# Altium project Baseboard-v3.1.PrjPcb (part 8 of 8)
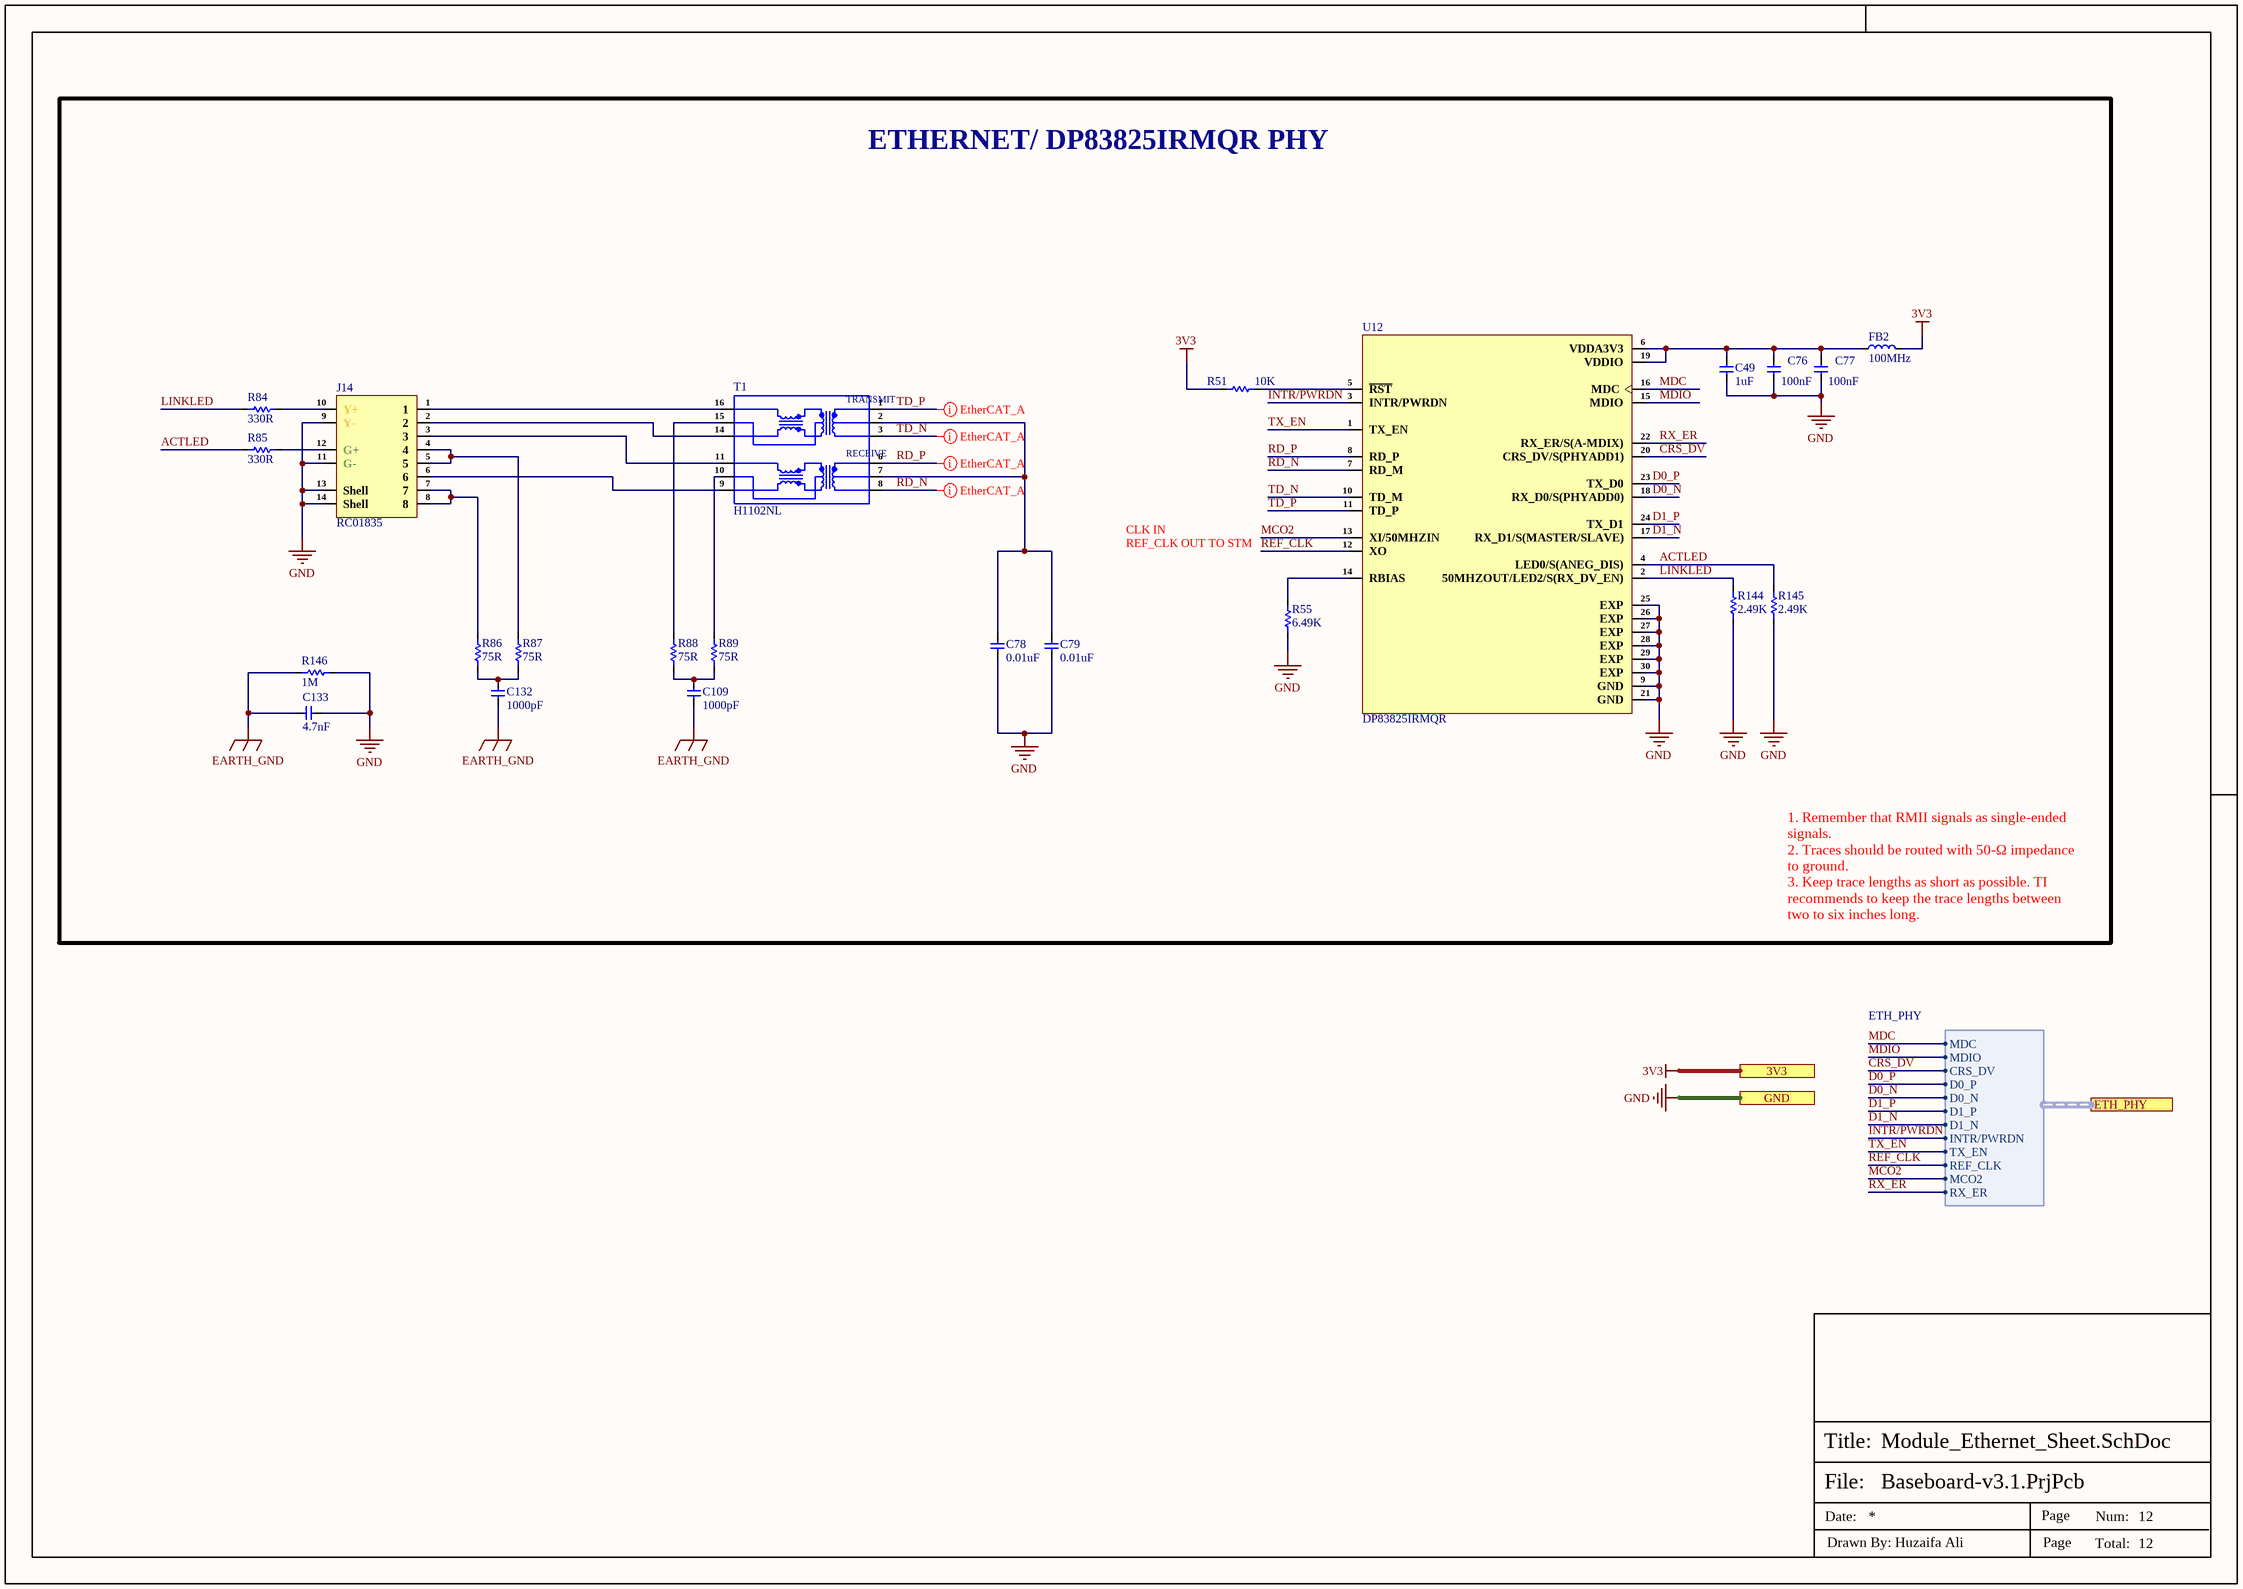
[diagram p12: Module_Ethernet_Sheet.SchDoc]

## Nets that join several sheets
3V3: GPIOs_Expander_Relay_Sheet (12 pins), OLED_Sheet (6 pins), Power_Sheet (6 pins), RS485_RS232_Sheet (9 pins), Controller_Sheet (22 pins), LTE_Sheet (C81.2 C83.2 U10.7 U11.7), ESP32-C3_Sheet (20 pins), DIAL_Sheet (11 pins), Module_Ethernet_Sheet (FB2.2 R51.1)
5V: GPIOs_Expander_Relay_Sheet (5 pins), OLED_Sheet (C123.2 R139.2 U20.1), Power_Sheet (14 pins)
+12V: Power_Sheet (C33.1 L2.2 P10.1 U1.4), DIAL_Sheet (C51.2 C52.2 C53.2 L3.2)
GND: Connector (11 pins), GPIOs_Expander_Relay_Sheet (14 pins), OLED_Sheet (29 pins), Power_Sheet (43 pins), RS485_RS232_Sheet (11 pins), Controller_Sheet (25 pins), LTE_Sheet (47 pins), LTE_1 (79 pins), ESP32-C3_Sheet (28 pins), DIAL_Sheet (24 pins), Module_Ethernet_Sheet (22 pins)
GSM_PWR: Power_Sheet (6 pins), LTE_Sheet (R91.2 R100.2), LTE_1 (D18.2 FB3.2)
GSM_PWR_2: Power_Sheet (6 pins), LTE_Sheet (R90.2 R99.2), LTE_1 (D25.2 FB4.2)
SIM1_VDD_1: LTE_Sheet (C84.2 J15.C1 U14.5), LTE_1 (U16.18)
SIM1_VDD_2: LTE_Sheet (SB1.1), LTE_1 (U17.18)
SIM2_VDD_1: LTE_Sheet (SB3.1), LTE_1 (U16.56)
USB_VBUS: LTE_Sheet (F3.1), LTE_1 (R142.1 R143.1)
VCC: Connector (D2.2 F2.2), Power_Sheet (9 pins)
VDD_EXT_1: LTE_Sheet (R58.2 SB5.1), LTE_1 (C100.2 U16.40)
VDD_EXT_2: LTE_Sheet (C80.2 SB7.1 U10.3 U10.6), LTE_1 (C101.2 U17.40)
13PIN_TERMINAL.INPUT_1: Connector (J4.1), GPIOs_Expander_Relay_Sheet (R35.2)
13PIN_TERMINAL.INPUT_2: Connector (J4.2), GPIOs_Expander_Relay_Sheet (R37.2)
13PIN_TERMINAL.INPUT_3: Connector (J4.3), GPIOs_Expander_Relay_Sheet (R39.2)
13PIN_TERMINAL.INPUT_4: Connector (J6.1), GPIOs_Expander_Relay_Sheet (R41.2)
13PIN_TERMINAL.INPUT_5: Connector (J6.2), GPIOs_Expander_Relay_Sheet (R43.2)
13PIN_TERMINAL.INPUT_6: Connector (J6.3), GPIOs_Expander_Relay_Sheet (R45.2)
13PIN_TERMINAL.INPUT_7: Connector (J8.1), GPIOs_Expander_Relay_Sheet (R36.2)
13PIN_TERMINAL.INPUT_8: Connector (J8.2), GPIOs_Expander_Relay_Sheet (R38.2)
13PIN_TERMINAL.INPUT_9: Connector (J8.3), GPIOs_Expander_Relay_Sheet (R40.2)
13PIN_TERMINAL.INPUT_10: Connector (J9.1), GPIOs_Expander_Relay_Sheet (R42.2)
13PIN_TERMINAL.INPUT_11: Connector (J9.2), GPIOs_Expander_Relay_Sheet (R44.2)
13PIN_TERMINAL.INPUT_12: Connector (J9.3), GPIOs_Expander_Relay_Sheet (R46.2)
/CS: Controller_Sheet (J11.5 U7.96), DIAL_Sheet (U9.2)
BTN: OLED_Sheet (C122.2 SW9.1 SW9.2), Controller_Sheet (R133.1 U7.4)
BTN1: OLED_Sheet (C103.2 SW4.1 SW4.2), Controller_Sheet (R94.2 U7.1)
BTN2: OLED_Sheet (C104.2 SW5.1 SW5.2), Controller_Sheet (R95.2 U7.2)
BTN3: OLED_Sheet (C105.2 SW6.1 SW6.2), Controller_Sheet (R96.2 U7.3)
CRS_DV: Controller_Sheet (U7.32), Module_Ethernet_Sheet (U12.20)
D0_N: Controller_Sheet (U7.33), Module_Ethernet_Sheet (U12.18)
D0_P: Controller_Sheet (U7.51), Module_Ethernet_Sheet (U12.23)
D1_N: Controller_Sheet (U7.34), Module_Ethernet_Sheet (U12.17)
D1_P: Controller_Sheet (U7.52), Module_Ethernet_Sheet (U12.24)
EN: Controller_Sheet (U7.38), ESP32-C3_Sheet (6 pins)
FSYNC: Controller_Sheet (U7.77), DIAL_Sheet (C62.2 U9.4)
GPIO9: Controller_Sheet (U7.5), ESP32-C3_Sheet (5 pins)
GSM_BUCK_EN: Power_Sheet (R13.2 U2.1), Controller_Sheet (U7.42)
GSM_BUCK_EN2: Power_Sheet (R26.2 U4.1), Controller_Sheet (U7.45)
GSM_PWR_EN: Controller_Sheet (U7.41), LTE_Sheet (R113.2)
GSM_PWR_EN_2: Controller_Sheet (U7.44), LTE_Sheet (R115.2)
GSM_RST: Controller_Sheet (U7.40), LTE_Sheet (R107.2)
GSM_RST_2: Controller_Sheet (U7.43), LTE_Sheet (R109.2)
GSM_RX: LTE_Sheet (U11.4), LTE_1 (U16.2)
GSM_RX_2: LTE_Sheet (U10.4), LTE_1 (U17.2)
GSM_TX: LTE_Sheet (U11.5), LTE_1 (U16.1)
GSM_TX_2: LTE_Sheet (U10.5), LTE_1 (U17.1)
GSM_USB.GSM_USB_D_N: Connector (R63.1), Controller_Sheet (R20.1), LTE_Sheet (D24.2 J22.2), LTE_1 (R50.1 R134.1)
GSM_USB.GSM_USB_D_P: Connector (R64.1), Controller_Sheet (R25.1), LTE_Sheet (D24.1 J22.3), LTE_1 (R135.1 R136.1)
IN_1: Connector (J1.2), GPIOs_Expander_Relay_Sheet (R3.3)
IN_2: Connector (J2.2), GPIOs_Expander_Relay_Sheet (R48.3)
IN_3: Connector (J7.2), GPIOs_Expander_Relay_Sheet (R32.3)
INTR/PWRDN: Controller_Sheet (U7.17), Module_Ethernet_Sheet (U12.3)
IO1: GPIOs_Expander_Relay_Sheet (D8.6 R24.4 R35.1), Controller_Sheet (U7.83)
IO2: GPIOs_Expander_Relay_Sheet (D8.5 R24.3 R37.1), Controller_Sheet (U7.84)
IO3: GPIOs_Expander_Relay_Sheet (D8.4 R24.2 R39.1), Controller_Sheet (U7.85)
IO4: GPIOs_Expander_Relay_Sheet (D10.6 R24.1 R41.1), Controller_Sheet (U7.57)
IO5: GPIOs_Expander_Relay_Sheet (D10.5 R23.4 R43.1), Controller_Sheet (U7.58)
IO6: GPIOs_Expander_Relay_Sheet (D10.4 R23.3 R45.1), Controller_Sheet (U7.59)
IO7: GPIOs_Expander_Relay_Sheet (D9.6 R23.2 R36.1), Controller_Sheet (U7.60)
IO8: GPIOs_Expander_Relay_Sheet (D9.5 R23.1 R38.1), Controller_Sheet (U7.61)
IO9: GPIOs_Expander_Relay_Sheet (D9.4 R22.4 R40.1), Controller_Sheet (U7.62)
IO10: GPIOs_Expander_Relay_Sheet (D11.6 R22.3 R42.1), Controller_Sheet (U7.15)
IO11: GPIOs_Expander_Relay_Sheet (D11.5 R22.2 R44.1), Controller_Sheet (U7.18)
IO12: GPIOs_Expander_Relay_Sheet (D11.4 R22.1 R46.1), Controller_Sheet (U7.7)
MCO2: Controller_Sheet (U7.66), Module_Ethernet_Sheet (U12.13)
MCU_RX: Controller_Sheet (U7.86), LTE_Sheet (U11.8)
MCU_RX_2: Controller_Sheet (U7.78), LTE_Sheet (U10.8)
MCU_TX: Controller_Sheet (U7.87), LTE_Sheet (U11.1)
MCU_TX_2: Controller_Sheet (U7.79), LTE_Sheet (U10.1)
MDC: Controller_Sheet (U7.16), Module_Ethernet_Sheet (U12.16)
MDIO: Controller_Sheet (U7.25), Module_Ethernet_Sheet (U12.15)
NC_1: Connector (J1.1), GPIOs_Expander_Relay_Sheet (R3.2)
NC_2: Connector (J2.1), GPIOs_Expander_Relay_Sheet (R48.2)
NC_3: Connector (J7.1), GPIOs_Expander_Relay_Sheet (R32.2)
NETLIGHT: LTE_Sheet (R102.1), LTE_1 (U16.41)
NETLIGHT_2: LTE_Sheet (R101.1), LTE_1 (U17.41)
NO_1: Connector (J1.3), GPIOs_Expander_Relay_Sheet (R3.4)
NO_2: Connector (J2.3), GPIOs_Expander_Relay_Sheet (R48.4)
NO_3: Connector (J7.3), GPIOs_Expander_Relay_Sheet (R32.4)
OLED_ON/OFF: OLED_Sheet (Q11.1 R2.2), Controller_Sheet (U7.46)
PCLK: Controller_Sheet (U7.89), DIAL_Sheet (C63.2 U9.5)
PCM_MISO: Controller_Sheet (U7.90), DIAL_Sheet (U9.7)
PCM_MOSI: Controller_Sheet (U7.80), DIAL_Sheet (U9.8)
PWRKEY: LTE_Sheet (C88.2 D17.1 Q8.3), LTE_1 (U16.39)
PWRKEY_2: LTE_Sheet (C89.2 D23.1 Q9.3), LTE_1 (U17.39)
RE/DE/RS485: RS485_RS232_Sheet (R81.2), Controller_Sheet (U7.82)
REF_CLK: Controller_Sheet (U7.24), Module_Ethernet_Sheet (U12.12)
RELAY_1: GPIOs_Expander_Relay_Sheet (U6.1), Controller_Sheet (U7.63)
RELAY_2: GPIOs_Expander_Relay_Sheet (U6.2), Controller_Sheet (U7.64)
RELAY_3: GPIOs_Expander_Relay_Sheet (U6.3), Controller_Sheet (U7.65)
RF_SW: Controller_Sheet (U7.39), ESP32-C3_Sheet (R122.2 U13.B1)
RING: Connector (J12.1), DIAL_Sheet (D21.4 R82.2)
RS232_RX: Connector (J13.2), RS485_RS232_Sheet (F22.1)
RS232_TX: Connector (J13.3), RS485_RS232_Sheet (F19.1)
RS485_N: Connector (J10.1), RS485_RS232_Sheet (F20.2)
RS485_P: Connector (J10.2), RS485_RS232_Sheet (F21.2)
RST_GSM: LTE_Sheet (C86.2 D16.1 Q6.3), LTE_1 (U16.83)
RST_GSM_2: LTE_Sheet (C87.2 D22.1 Q7.3), LTE_1 (U17.83)
RSTB: Controller_Sheet (U7.95), DIAL_Sheet (R59.2 U9.18)
RX_ER: Controller_Sheet (U7.81), Module_Ethernet_Sheet (U12.22)
RXD/RS485/RS232: RS485_RS232_Sheet (R79.1), Controller_Sheet (U7.68)
SCL: OLED_Sheet (J18.11), Controller_Sheet (U7.92)
SCLK: Controller_Sheet (J11.3 U7.47), DIAL_Sheet (U9.40)
SDA: OLED_Sheet (J18.12), Controller_Sheet (U7.93)
SIM_CD_B1: LTE_Sheet (R58.1 R126.2), LTE_1 (U16.14)
SIM_CD_B2: LTE_Sheet (R65.1 R130.2), LTE_1 (SB2.2 SB9.2)
SIM_CLK_B1: LTE_Sheet (R111.2), LTE_1 (C112.1 U16.16)
SIM_CLK_B2: LTE_Sheet (R128.2), LTE_1 (SB8.2 SB15.2)
SIM_DATA_B1: LTE_Sheet (R112.1), LTE_1 (C110.1 U16.15)
SIM_DATA_B2: LTE_Sheet (R129.1), LTE_1 (SB4.2 SB11.2)
SIM_RST_B1: LTE_Sheet (R106.2), LTE_1 (C111.1 U16.17)
SIM_RST_B2: LTE_Sheet (R127.2), LTE_1 (SB6.2 SB13.2)
SPI_MISO: Controller_Sheet (J11.1 U7.53), DIAL_Sheet (U9.39)
SPI_MOSI: Controller_Sheet (J11.4 U7.54), DIAL_Sheet (U9.38)
STATUS: LTE_Sheet (R93.1), LTE_1 (U16.42)
STATUS_2: LTE_Sheet (R92.1), LTE_1 (U17.42)
TIP: Connector (J12.2), DIAL_Sheet (D21.1 R62.1)
TX_EN: Controller_Sheet (U7.48), Module_Ethernet_Sheet (U12.1)
TXD/RS485/RS232: RS485_RS232_Sheet (R80.1), Controller_Sheet (U7.69)
U0RXD: Controller_Sheet (U7.55), ESP32-C3_Sheet (J19.4 J21.4 U19.27)
U0TXD: Controller_Sheet (U7.56), ESP32-C3_Sheet (J19.3 J21.3 U19.28)